# Altium project TSE_commutation_board.PrjPcb
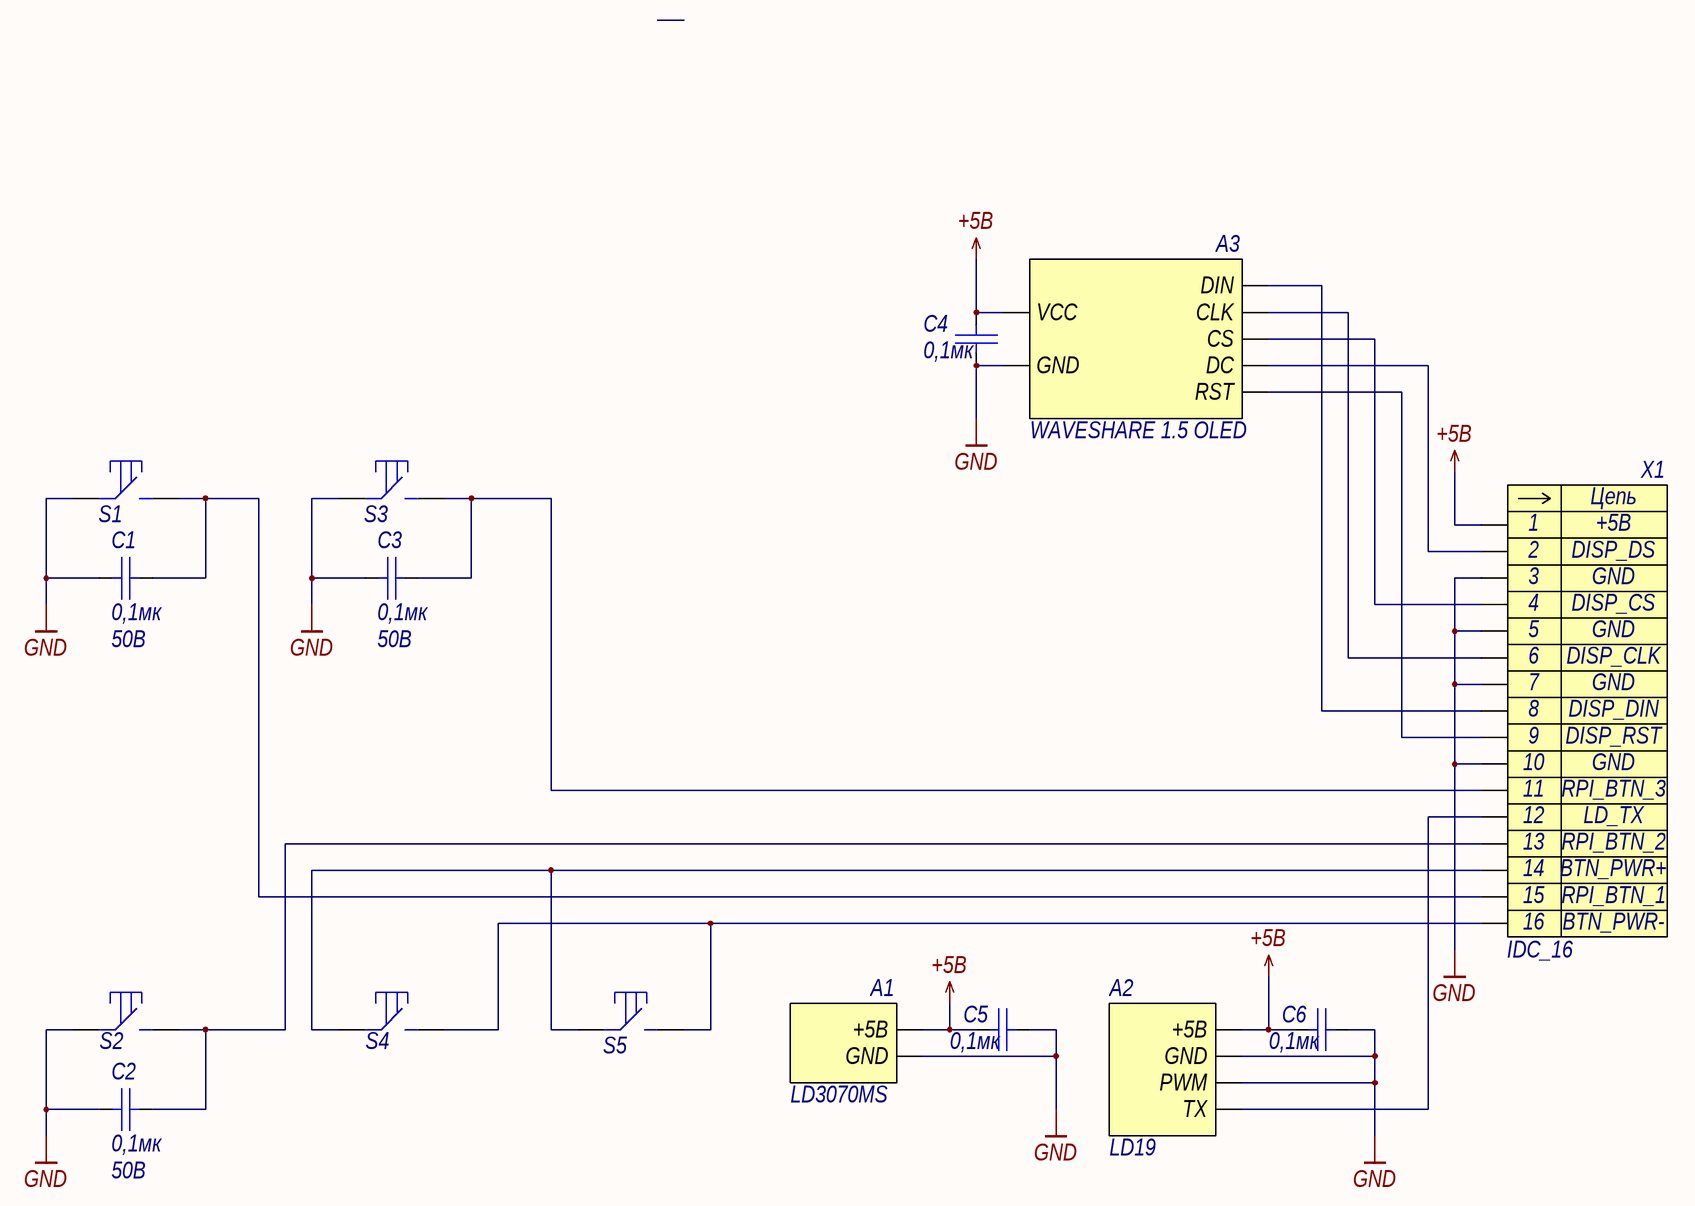
[diagram p0: TSE_commutation_board.SchDoc]
1 sheet, 15 parts. Net scope: global (net labels, ports and power ports of the same name join across sheets).
Board file: TSE_commutation_board.PcbDoc

## Sheet TSE_commutation_board.SchDoc
size 420 x 297 mm; SheetNumber: 1; SheetTotal: 1

### Parts
A1  LD3070MS  [LD3070MS]
A2  LD19  [LD19]
A3  WAVESHARE 1.5 OLED  [1.5_OLED]
C1  Voltage: 50В  [C0603]  (hidden comment: 0,1мк)
C2  Voltage: 50В  [C0603]  (hidden comment: 0,1мк)
C3  Voltage: 50В  [C0603]  (hidden comment: 0,1мк)
C4  0,1мк  [C0603]
C5  0,1мк  [C0603]
C6  0,1мк  [C0603]
S1  IT-1187  [it-1187]  (value not drawn)
S2  IT-1187  [it-1187]  (value not drawn)
S3  IT-1187  [it-1187]  (value not drawn)
S4  IT-1187  [it-1187]  (value not drawn)
S5  5,8  [BTN5,8]  (value not drawn)
X1  IDC_16  [IDC1.27_16]

### Nets
+5В: A1.1(+5В) A2.4(+5В) A3.1(VCC) C4.2 C5.2 C6.2 X1.1
GND: A1.3(GND) A2.2(PWM) A2.3(GND) A3.2(GND) C1.1 C2.1 C3.1 C4.1 C5.1 C6.1 S1.1 S2.1 S3.1 X1.3 X1.5 X1.7 X1.10
NetA2_1: A2.1(TX) X1.12
NetA3_3: A3.3(DIN) X1.8
NetA3_4: A3.4(CLK) X1.6
NetA3_5: A3.5(CS) X1.4
NetA3_6: A3.6(DC) X1.2
NetA3_7: A3.7(RST) X1.9
NetC1_2: C1.2 S1.2 X1.15
NetC2_2: C2.2 S2.2 X1.13
NetC3_2: C3.2 S3.2 X1.11
NetS4_1: S4.1 S5.2 X1.14
NetS4_2: S4.2 S5.3 X1.16

### Notes on the sheet
- Перв. примен.
- Справ. №
- Подп. и дата
- Инв. № дубл.
- Взам. инв. №
- Изм.
- Лист
- № докум.
- Подп.
- Дата
- Лит.
- Масса
- Масштаб
- Т.контр.
- Пров.
- Разраб.
- Листов
- Инв. № подл.
- Н.контр.
- Файл:
- Утв.
- Копировал
- Формат

### Library data of the parts
A3 = WAVESHARE 1.5 OLED: OLED дисплей 1.5 дюйма; Наименование: WAVESHARE 1.5 OLED
C1-C6 = CC0603JPX7R9BB104: Конденсатор кер. 0,1мкФ 50В; Manufacturer: Yageo; TKE: X7R; Name: CC0603JPX7R9BB104; Value: 0,1мк
S1 S3 = button: тактовая кнопка SMD; Name: IT-1187
S2 S4 = IT-1187: тактовая кнопка SMD; Name: IT-1187
S5 = latching_button: кнопка с фиксацией; Name: 5,8
X1 = IDC_16: Разъем - 16 конт. прямая вилка на плату; Contact_1: +5В; Contact_2: DISP_DS; Contact_3: GND; Contact_4: DISP_CS; Contact_6: DISP_CLK; Contact_8: DISP_DIN; Contact_9: DISP_RST; Contact_11: RPI_BTN_3; Contact_12: LD_TX; Contact_13: RPI_BTN_2; Contact_14: BTN_PWR+; Contact_15: RPI_BTN_1; Contact_16: BTN_PWR-; Наименование: IDC_16; Contact_5: GND; Contact_7: GND; Contact_10: GND
A1 = LD3070MS: Name: LD3070MS
A2 = LD19: Name: LD19